# Altium project Martin_Changes.PrjPcb
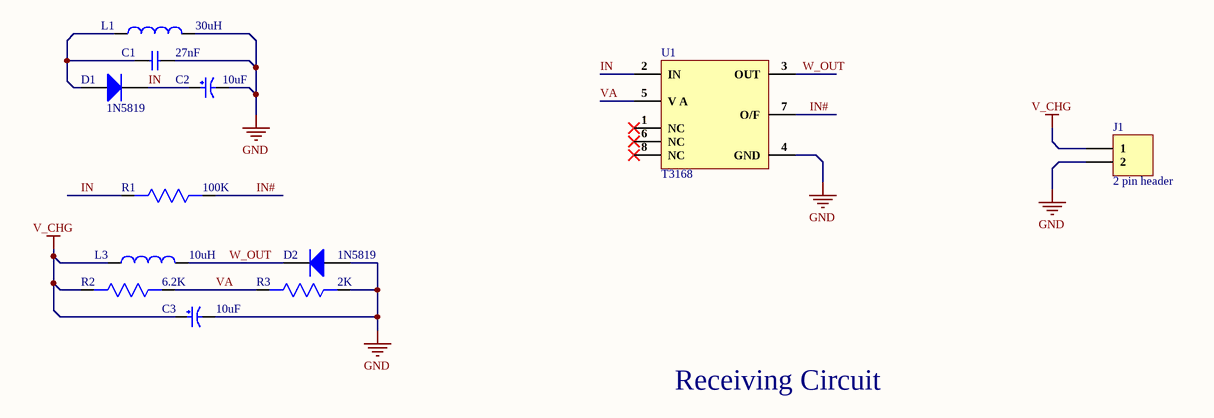
[diagram p0: Wireless_Receiver_Sheet.SchDoc]
2 sheets, 23 parts. Net scope: global (net labels, ports and power ports of the same name join across sheets).
Sheets:
  Wireless_Receiver_Sheet.SchDoc
  Wireless_Transmitter_Sheet.SchDoc

## Sheet Wireless_Receiver_Sheet.SchDoc
size A4

### Parts
C1  27nF  [CAP 0201]
C2  10uF  [Cap Case-C]
C3  10uF  [Cap Case-C]
D1  1N5819
D2  1N5819
J1  2 pin header
L1  30uH  [SRU8028-220Y]
L3  10uH  [SRU8028-220Y]
R1  100K  [Res-0201]
R2  6.2K  [Res-0201]
R3  2K  [Res-0201]
U1  T3168

### Nets
GND: C1.2 C2.1 C3.1 D2.2(A) J1.2 L1.2 R3.1 U1.4(GND)
V_CHG: C3.2 J1.1 L3.1 R2.2
IN: C2.2 D1.1(K) R1.2 U1.2(IN)
IN#: R1.1 U1.7(O/F)
VA: R2.1 R3.2 U1.5(V_A)
W_OUT: D2.1(K) L3.2 U1.3(OUT)
NetC1_1: C1.1 D1.2(A) L1.1

Not connected (* = marked no-connect by the designer): U1 1(NC)* 6(NC)* 8(NC)*

### Notes on the sheet
- Receiving Circuit

### Library data of the parts
C1 = CC0201KRX7R8BB103: CAP CER X7R 0201; Manufacturer: Yageo; Supplier 1: Digi-Key; Manufacturer Part Number: CC0201KRX7R8BB103; RoHS: Yes; Stock 1: 19600; Pricing 1: 1=0.10000, 10=0.02800, 50=0.01520, 100=0.01240, 500=0.00886, 1000=0.00696, 2500=0.00632, 5000=0.00582 (USD); RoHS Compliant: Yes; Supplier Part Number 1: 13-CC0201KRX7R8BB103CT-ND
C2 C3 = 293D106X0025C2TE3: CAP TANT 10UF 20% 25V 2312; Manufacturer: Vishay Sprague; Dielectric Material: Tantalum; ESR (Equivalent Series Resistance): 1.5R; Ripple Current: 190mA; Leakage Current: 2.5uA; Polarity: Polar; Dissipation Factor: 6%; Supplier 1: Digi-Key; Manufacturer Part Number: 293D106X0025C2TE3; RoHS: Yes; Category: Tantalum Capacitors; Stock 1: 14194; Pricing 1: 1=0.45000, 10=0.31600, 50=0.23920, 100=0.20840 (USD); Mount: Surface Mount,PCB; Case/Package: Molded; Number of Pins: 2; Case Code (Metric): 6032; Case Code (Imperial): 2312; Min Operating Temperature: -55°C; Max Operating Temperature: 125°C; Capacitance: 10uF; Tolerance: 20%; Package Quantity: 1; Voltage Rating: 25V; Packaging: Tape and Reel; Voltage Rating (DC): 25V; Termination: SMD/SMT; Features: General Purpose; Series: TANTAMOUNT® 293D; Construction: Flat; Length: 6mm; Width: 0.126inch; Height: 2.5mm; Depth: 3.2mm; Height - Seated (Max): 0.11inch; Radiation Hardening: No; REACH SVHC: Unknown; Lead Free: Lead Free; RoHS Compliant: Yes; ComponentLink1URL: https://datasheet.ciiva.com/258/293d-258835.pdf?src-supplier=Digi-Key; ComponentLink1Description: https://datasheet.ciiva.com/258/293d-258835.pdf?src-supplier=Digi-Key; ComponentLink2URL: https://datasheet.ciiva.com/15163/getdatasheetpartid-87477-15163227.pdf?src-supplier=Verical; ComponentLink2Description: https://datasheet.ciiva.com/15163/getdatasheetpartid-87477-15163227.pdf?src-supplier=Verical; ComponentLink3URL: https://datasheet.ciiva.com/16508/293d-16508059.pdf?src-supplier=Future+Electronics; ComponentLink3Description: https://datasheet.ciiva.com/16508/293d-16508059.pdf?src-supplier=Future+Electronics; ComponentLink4URL: https://datasheet.ciiva.com/3003/293d-3003820.pdf?src-supplier=Avnet; ComponentLink4Description: https://datasheet.ciiva.com/3003/293d-3003820.pdf?src-supplier=Avnet; ComponentLink5URL: https://datasheet.ciiva.com/18444/70212567-18444876.pdf?src-supplier=Allied+Electronics; ComponentLink5Description: https://datasheet.ciiva.com/18444/70212567-18444876.pdf?src-supplier=Allied+Electronics; ComponentLink6URL: https://datasheet.ciiva.com/46382/1796648-46382044.pdf?src-supplier=Element14; ComponentLink6Description: https://datasheet.ciiva.com/46382/1796648-46382044.pdf?src-supplier=Element14; ComponentLink7URL: https://datasheet.ciiva.com/11244/293d-11244094.pdf?src-supplier=Avnet; ComponentLink7Description: https://datasheet.ciiva.com/11244/293d-11244094.pdf?src-supplier=Avnet; ComponentLink8URL: https://datasheet.ciiva.com/16631/293d-16631759.pdf?src-supplier=Avnet+Europe; ComponentLink8Description: https://datasheet.ciiva.com/16631/293d-16631759.pdf?src-supplier=Avnet+Europe; ComponentLink9URL: https://datasheet.ciiva.com/258/293d-258834.pdf?src-supplier=Digi-Key; ComponentLink9Description: https://datasheet.ciiva.com/258/293d-258834.pdf?src-supplier=Digi-Key; ComponentLink10URL: https://datasheet.ciiva.com/258/293d-258836.pdf?src-supplier=Digi-Key; ComponentLink10Description: https://datasheet.ciiva.com/258/293d-258836.pdf?src-supplier=Digi-Key; ComponentLink11URL: https://datasheet.ciiva.com/12884/293d-239871-12884366.pdf?src-supplier=Mouser; ComponentLink11Description: https://datasheet.ciiva.com/12884/293d-239871-12884366.pdf?src-supplier=Mouser; Supplier Part Number 1: 718-1044-1-ND
D1 D2 = diode
L1 L3 = SRU8028-220Y: FIXED IND 22UH 1.6A 106 MOHM SMD; Manufacturer: Bourns; Core Material: Ferrite; Tolerance: 30%; DC Resistance (DCR): 106mR; Self Resonant Frequency: 20MHz; Saturation Current: 1.5A; Shielding: Shielded; Test Frequency: 100kHz; Q Factor: 22; Current: 2.8A; Supplier 1: Digi-Key; Manufacturer Part Number: SRU8028-220Y; RoHS: Yes; Category: Fixed Inductors; Stock 1: 1920; Pricing 1: 1=0.92000, 10=0.85800, 25=0.79200, 50=0.66000, 100=0.62040, 250=0.55440, 500=0.47520 (USD); Mount: Surface Mount; Case/Package: 8028; Number of Pins: 2; Min Operating Temperature: -40°C; Max Operating Temperature: 125°C; Inductance: 22uH; Max DC Current: 1.6A; Packaging: Tape and Reel; Inductance Tolerance: 30%; Package Quantity: 1500; Current Rating: 1.6A; Resistor Type: Wirewound; RMS Current (Irms): 1.6A; Termination: SMD/SMT; DC Current: 1.6A; Series: SRU8028; Length: 0.315inch; Width: 0.315inch; Height: 2.8mm; Height - Seated (Max): 0.122inch; Depth: 8.3mm; Military Standard: Not; REACH SVHC: No SVHC; RoHS Compliant: Yes; ComponentLink1URL: https://datasheet.ciiva.com/3866/41849355s8208904n1506-3866094.pdf?src-supplier=Avnet; ComponentLink1Description: https://datasheet.ciiva.com/3866/41849355s8208904n1506-3866094.pdf?src-supplier=Avnet; ComponentLink2URL: https://datasheet.ciiva.com/3866/41849355s8208904n1506-3866094.pdf?src-supplier=Arrow+Electronics; ComponentLink2Description: https://datasheet.ciiva.com/3866/41849355s8208904n1506-3866094.pdf?src-supplier=Arrow+Electronics; ComponentLink3URL: https://datasheet.ciiva.com/7848/sru8028-7848101.pdf?src-supplier=Element14; ComponentLink3Description: https://datasheet.ciiva.com/7848/sru8028-7848101.pdf?src-supplier=Element14; ComponentLink4URL: https://datasheet.ciiva.com/6691/sru8028-6691830.pdf?src-supplier=Digi-Key; ComponentLink4Description: https://datasheet.ciiva.com/6691/sru8028-6691830.pdf?src-supplier=Digi-Key; ComponentLink5URL: https://datasheet.ciiva.com/7848/1776946-7848102.pdf?src-supplier=Element14; ComponentLink5Description: https://datasheet.ciiva.com/7848/1776946-7848102.pdf?src-supplier=Element14; ComponentLink6URL: https://datasheet.ciiva.com/6691/sru8028-6691834.pdf?src-supplier=Digi-Key; ComponentLink6Description: https://datasheet.ciiva.com/6691/sru8028-6691834.pdf?src-supplier=Digi-Key; ComponentLink7URL: https://datasheet.ciiva.com/6691/sru8028-6691836.pdf?src-supplier=Digi-Key; ComponentLink7Description: https://datasheet.ciiva.com/6691/sru8028-6691836.pdf?src-supplier=Digi-Key; ComponentLink8URL: https://datasheet.ciiva.com/6161/sru8028-6161214.pdf?src-supplier=Farnell; ComponentLink8Description: https://datasheet.ciiva.com/6161/sru8028-6161214.pdf?src-supplier=Farnell; ComponentLink9URL: https://datasheet.ciiva.com/17285/sru8028-17285550.pdf?src-supplier=Avnet+Europe; ComponentLink9Description: https://datasheet.ciiva.com/17285/sru8028-17285550.pdf?src-supplier=Avnet+Europe; Supplier Part Number 1: SRU8028-220YCT-ND
R1 = RC0201FR-07100KL: RES SMD 100K OHM 1% 1/20W 0201; Manufacturer: Yageo; Resistance: 100kR; Power Rating: 50mW; Voltage Rating: 25V; Temperature Coefficient: 200ppm/°C; ComponentLink1URL: http://www.yageo.com/documents/recent/PYu-RC_Group_51_RoHS_L_9.pdf?src-supplier=Digi-Key; ComponentLink1Description: http://www.yageo.com/documents/recent/PYu-RC_Group_51_RoHS_L_9.pdf?src-supplier=Digi-Key; ComponentLink2URL: http://www.yageo.com.tw/exep/pages/download/literatures/PYu-R_INT-thick_7.pdf?src-supplier=Digi-Key; ComponentLink2Description: http://www.yageo.com.tw/exep/pages/download/literatures/PYu-R_INT-thick_7.pdf?src-supplier=Digi-Key; Supplier 1: Digi-Key; Manufacturer Part Number: RC0201FR-07100KL; Stock 1: 2817321; Pricing 1: 1=0.1, 10=0.036, 100=0.0148, 1000=0.0067, 2500=0.0058, 5000=0.0048 (USD); Case/Package: 0201; Number of Pins: 2; Case Code (Imperial): 0201; Case Code (Metric): 0603; Contact Plating: Tin,Matte; Size Code: 0201; Min Operating Temperature: -55°C; Max Operating Temperature: 125°C; Tolerance: 1%; Packaging: Tape and Reel; Package Quantity: 10000; Termination: SMD/SMT; Resistor Type: Thick Film; Number of Terminations: 2; Max Power Dissipation: 50mW; Voltage Rating (DC): 25V; Features: Moisture Resistant; Series: RC; Resistance Tolerance: 1%; Construction: Rectangular; Length: 0.024inch; Width: 0.012inch; Height: 0.01inch; Depth: 0.3mm; REACH SVHC: No SVHC; Military Standard: Not; Lead Free: Lead Free; RoHS Compliant: Yes; ComponentLink3URL: http://www.farnell.com/datasheets/2167052.pdf?src-supplier=Element14; ComponentLink3Description: http://www.farnell.com/datasheets/2167052.pdf?src-supplier=Element14; ComponentLink4URL: http://www.yageo.com/documents/recent/PYu-RC_Group_51_RoHS_L_10.pdf?src-supplier=Digi-Key; ComponentLink4Description: http://www.yageo.com/documents/recent/PYu-RC_Group_51_RoHS_L_10.pdf?src-supplier=Digi-Key; ComponentLink5URL: https://www.verical.com/server-webapp/html/getDatasheet?partID=420441&src-supplier=Verical; ComponentLink5Description: https://www.verical.com/server-webapp/html/getDatasheet?partID=420441&src-supplier=Verical; ComponentLink6URL: http://www.farnell.com/datasheets/1421516.pdf?src-supplier=Element14; ComponentLink6Description: http://www.farnell.com/datasheets/1421516.pdf?src-supplier=Element14; ComponentLink7URL: http://www.yageo.com/documents/recent/PYu-RC0201_51_RoHS_L_8.pdf?src-supplier=Avnet+Europe; ComponentLink7Description: http://www.yageo.com/documents/recent/PYu-RC0201_51_RoHS_L_8.pdf?src-supplier=Avnet+Europe; Supplier Part Number 1: 311-100KMCT-ND
R2 = RMCF0201JT6K20: RES 6.2K OHM 5% 1/20W 0201; Manufacturer: Stackpole Electronics; Resistance: 6.2kR; Max Power Dissipation: 50mW; Temperature Coefficient: 200ppm/°C; Supplier 1: Digi-Key; Manufacturer Part Number: RMCF0201JT6K20; RoHS: Yes; Category: Chip SMD Resistors; Stock 1: 8800; Pricing 1: 1=0.10000, 10=0.01700, 100=0.00710, 1000=0.00318, 2500=0.00276, 5000=0.00228 (USD); Mount: Surface Mount; Case/Package: 0201; Case Code (Metric): 0603; Case Code (Imperial): 0201; Contact Plating: Tin,Matte; Min Operating Temperature: -55°C; Max Operating Temperature: 125°C; Packaging: Tape and Reel; Tolerance: 5%; Resistor Type: Thick Film; Number of Terminations: 2; Series: RMCF; Length: 0.024inch; Width: 0.012inch; Height: 0.009inch; Radiation Hardening: No; RoHS Compliant: Yes; ComponentLink1URL: https://www.seielect.com/catalog/SEI-RMCF_RMCP.pdf?src-supplier=Avnet; ComponentLink1Description: https://www.seielect.com/catalog/SEI-RMCF_RMCP.pdf?src-supplier=Avnet; ComponentLink2URL: https://www.seielect.com/Catalog/SEI-RMCF_RMCP.pdf?src-supplier=Digi-Key; ComponentLink2Description: https://www.seielect.com/Catalog/SEI-RMCF_RMCP.pdf?src-supplier=Digi-Key; ComponentLink3URL: https://www.seielect.com/catalog/SEI-Packaging.pdf?src-supplier=Digi-Key; ComponentLink3Description: https://www.seielect.com/catalog/SEI-Packaging.pdf?src-supplier=Digi-Key; Supplier Part Number 1: RMCF0201JT6K20CT-ND
R3 = RMCF0201JT2K00: RES 2K OHM 5% 1/20W 0201; Manufacturer: Stackpole Electronics; Resistance: 2kR; Power Rating: 50mW; Temperature Coefficient: 200ppm/°C; Supplier 1: Digi-Key; Manufacturer Part Number: RMCF0201JT2K00; RoHS: Yes; Category: Chip SMD Resistors; Stock 1: 15230; Pricing 1: 1=0.10000, 10=0.01700, 100=0.00710, 1000=0.00318, 2500=0.00276, 5000=0.00228 (USD); Mount: Surface Mount; Case/Package: 0201; Case Code (Metric): 0603; Case Code (Imperial): 0201; Contact Plating: Tin,Matte; Min Operating Temperature: -55°C; Max Operating Temperature: 125°C; Packaging: Tape and Reel; Tolerance: 5%; Resistor Type: Thick Film; Number of Terminations: 2; Max Power Dissipation: 50mW; Series: RMCF; Length: 0.024inch; Width: 0.012inch; Height: 0.009inch; Radiation Hardening: No; RoHS Compliant: Yes; ComponentLink1URL: https://www.seielect.com/catalog/SEI-RMCF_RMCP.pdf?src-supplier=Avnet; ComponentLink1Description: https://www.seielect.com/catalog/SEI-RMCF_RMCP.pdf?src-supplier=Avnet; ComponentLink2URL: https://www.seielect.com/Catalog/SEI-RMCF_RMCP.pdf?src-supplier=Digi-Key; ComponentLink2Description: https://www.seielect.com/Catalog/SEI-RMCF_RMCP.pdf?src-supplier=Digi-Key; ComponentLink3URL: https://www.seielect.com/catalog/SEI-RMCF_RMCP.pdf?src-supplier=Avnet+Asia; ComponentLink3Description: https://www.seielect.com/catalog/SEI-RMCF_RMCP.pdf?src-supplier=Avnet+Asia; Supplier Part Number 1: RMCF0201JT2K00CT-ND

## Sheet Wireless_Transmitter_Sheet.SchDoc
size A4
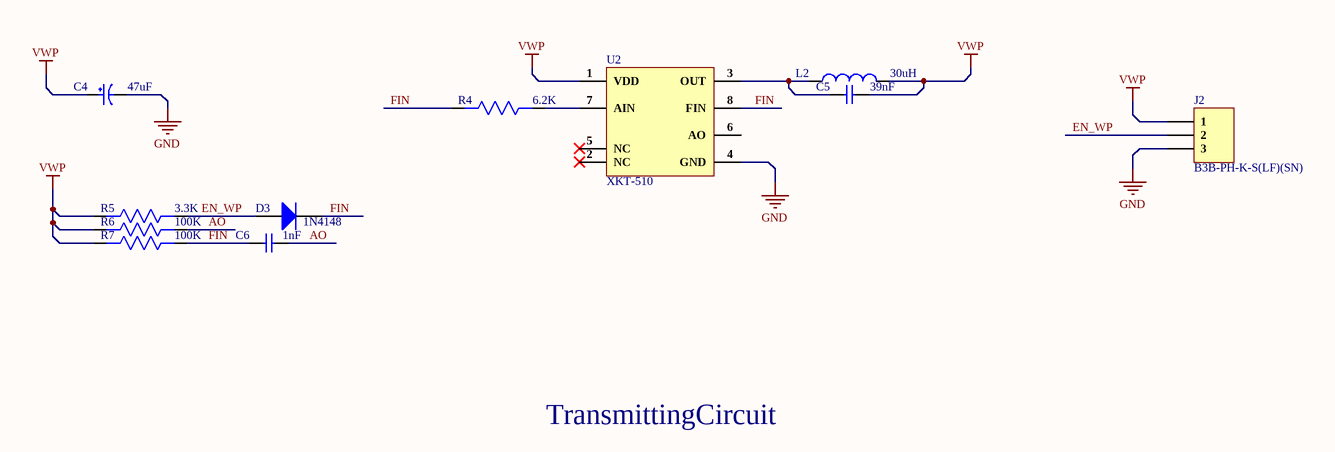
[diagram p1: Wireless_Transmitter_Sheet.SchDoc]

### Parts
C4  47uF  [Cap Case-C]
C5  39nF  [CAP 0201]
C6  1nF  [CAP 0201]
D3  1N4148
J2  B3B-PH-K-S(LF)(SN)  [B3B-PH-K-S(LF)(SN)]
L2  30uH  [SRU8028-220Y]
R4  6.2K  [Res-0201]
R5  3.3K  [Res-0201]
R6  100K  [Res-0201]
R7  100K  [Res-0201]
U2  XKT-510

### Nets
GND: C4.1 J2.3 U2.4(GND)
VWP: C4.2 C5.2 J2.1 L2.2 R5.2 R6.2 R7.2 U2.1(VDD)
AO: C6.2 R6.1
EN_WP: D3.2(A) J2.2 R5.1
FIN: C6.1 D3.1(K) R4.2 R7.1 U2.8(FIN)
NetC5_1: C5.1 L2.1 U2.3(OUT)
NetR4_1: R4.1 U2.7(AIN)

Not connected (* = marked no-connect by the designer): U2 2(NC)* 5(NC)* 6(AO)

### Notes on the sheet
- TransmittingCircuit

### Library data of the parts
C4 = 293D106X0025C2TE3: as C2 on sheet Wireless_Receiver_Sheet; Supplier 1: Digi-Key; Manufacturer Part Number: 293D106X0025C2TE3; RoHS: Yes; Category: Tantalum Capacitors; Stock 1: 14194; Pricing 1: 1=0.45000, 10=0.31600, 50=0.23920, 100=0.20840 (USD); Mount: Surface Mount,PCB; Case/Package: Molded; Number of Pins: 2; Case Code (Metric): 6032; Case Code (Imperial): 2312; Min Operating Temperature: -55°C; Max Operating Temperature: 125°C; Capacitance: 10uF; Tolerance: 20%; Package Quantity: 1; Voltage Rating: 25V; Packaging: Tape and Reel; Voltage Rating (DC): 25V; Termination: SMD/SMT; Features: General Purpose; Series: TANTAMOUNT® 293D; Construction: Flat; Length: 6mm; Width: 0.126inch; Height: 2.5mm; Depth: 3.2mm; Height - Seated (Max): 0.11inch; Radiation Hardening: No; REACH SVHC: Unknown; Lead Free: Lead Free; RoHS Compliant: Yes; ComponentLink1URL: https://datasheet.ciiva.com/258/293d-258835.pdf?src-supplier=Digi-Key; ComponentLink1Description: https://datasheet.ciiva.com/258/293d-258835.pdf?src-supplier=Digi-Key; ComponentLink2URL: https://datasheet.ciiva.com/15163/getdatasheetpartid-87477-15163227.pdf?src-supplier=Verical; ComponentLink2Description: https://datasheet.ciiva.com/15163/getdatasheetpartid-87477-15163227.pdf?src-supplier=Verical; ComponentLink3URL: https://datasheet.ciiva.com/16508/293d-16508059.pdf?src-supplier=Future+Electronics; ComponentLink3Description: https://datasheet.ciiva.com/16508/293d-16508059.pdf?src-supplier=Future+Electronics; ComponentLink4URL: https://datasheet.ciiva.com/3003/293d-3003820.pdf?src-supplier=Avnet; ComponentLink4Description: https://datasheet.ciiva.com/3003/293d-3003820.pdf?src-supplier=Avnet; ComponentLink5URL: https://datasheet.ciiva.com/18444/70212567-18444876.pdf?src-supplier=Allied+Electronics; ComponentLink5Description: https://datasheet.ciiva.com/18444/70212567-18444876.pdf?src-supplier=Allied+Electronics; ComponentLink6URL: https://datasheet.ciiva.com/46382/1796648-46382044.pdf?src-supplier=Element14; ComponentLink6Description: https://datasheet.ciiva.com/46382/1796648-46382044.pdf?src-supplier=Element14; ComponentLink7URL: https://datasheet.ciiva.com/11244/293d-11244094.pdf?src-supplier=Avnet; ComponentLink7Description: https://datasheet.ciiva.com/11244/293d-11244094.pdf?src-supplier=Avnet; ComponentLink8URL: https://datasheet.ciiva.com/16631/293d-16631759.pdf?src-supplier=Avnet+Europe; ComponentLink8Description: https://datasheet.ciiva.com/16631/293d-16631759.pdf?src-supplier=Avnet+Europe; ComponentLink9URL: https://datasheet.ciiva.com/258/293d-258834.pdf?src-supplier=Digi-Key; ComponentLink9Description: https://datasheet.ciiva.com/258/293d-258834.pdf?src-supplier=Digi-Key; ComponentLink10URL: https://datasheet.ciiva.com/258/293d-258836.pdf?src-supplier=Digi-Key; ComponentLink10Description: https://datasheet.ciiva.com/258/293d-258836.pdf?src-supplier=Digi-Key; ComponentLink11URL: https://datasheet.ciiva.com/12884/293d-239871-12884366.pdf?src-supplier=Mouser; ComponentLink11Description: https://datasheet.ciiva.com/12884/293d-239871-12884366.pdf?src-supplier=Mouser; Supplier Part Number 1: 718-1044-1-ND
C5 C6 = CC0201KRX7R8BB103: CAP CER X7R 0201; Manufacturer: Yageo; Supplier 1: Digi-Key; Manufacturer Part Number: CC0201KRX7R8BB103; RoHS: Yes; Stock 1: 19600; Pricing 1: 1=0.10000, 10=0.02800, 50=0.01520, 100=0.01240, 500=0.00886, 1000=0.00696, 2500=0.00632, 5000=0.00582 (USD); RoHS Compliant: Yes; Supplier Part Number 1: 13-CC0201KRX7R8BB103CT-ND
D3 = diode
J2 = B3B-PH-K-S(LF)(SN): CONN HEADER VERT 3POS 2MM; Manufacturer: JST; Number of Positions: 3; Connector Type: Male Pin; Current Rating: 2A; Contact Resistance: 20mR; Voltage Rating (AC): 100V; Insulation Resistance: 1MR; Gender: Male; Supplier 1: Future Electronics; Manufacturer Part Number: B3B-PH-K-S(LF)(SN); RoHS: Yes; Category: Headers and Wire Housings; Pricing 1: 1=0.07800, 500=0.06750, 1500=0.06580, 5000=0.06400, 15000=0.06240 (USD); Mount: Through Hole; Number of Pins: 3; Contact Plating: Tin,Copper; Color: Natural; Contact Material: Brass,Tin; Housing Color: White; Housing Material: Polyamide; Min Operating Temperature: -25°C; Max Operating Temperature: 85°C; Number of Rows: 1; Packaging: Bulk; Max Current Rating: 2A; Number of Poles: 3; Voltage Rating: 100V; Termination: Solder; Fastening Type: Detent; Number of Contacts: 3; Max Voltage Rating (AC): 100V; Max Voltage Rating (DC): 100V; Working Voltage: 100V; Orientation: Straight; Length: 7.9mm; Width: 4.5mm; Height: 9.4mm; Pitch: 2mm; Lead Pitch: 2mm; Contact Mating Length: 0.13inch; Depth: 4.5mm; Lead Free: Lead Free; REACH SVHC: No SVHC; ComponentLink1URL: https://datasheet.ciiva.com/6747/80560-6747401.pdf?src-supplier=Newark; ComponentLink1Description: https://datasheet.ciiva.com/6747/80560-6747401.pdf?src-supplier=Newark; ComponentLink2URL: https://datasheet.ciiva.com/11746/0900766b80826550-11746939.pdf?src-supplier=RSComponents; ComponentLink2Description: https://datasheet.ciiva.com/11746/0900766b80826550-11746939.pdf?src-supplier=RSComponents; ComponentLink3URL: https://datasheet.ciiva.com/26894/getdatasheetpartid-448114-26894774.pdf?src-supplier=Verical; ComponentLink3Description: https://datasheet.ciiva.com/26894/getdatasheetpartid-448114-26894774.pdf?src-supplier=Verical; ComponentLink4URL: https://datasheet.ciiva.com/712/eph-712455.pdf?src-supplier=Digi-Key; ComponentLink4Description: https://datasheet.ciiva.com/712/eph-712455.pdf?src-supplier=Digi-Key; ComponentLink5URL: https://datasheet.ciiva.com/26924/getdatasheetpartid-651387-26924028.pdf?src-supplier=Verical; ComponentLink5Description: https://datasheet.ciiva.com/26924/getdatasheetpartid-651387-26924028.pdf?src-supplier=Verical; ComponentLink6URL: https://datasheet.ciiva.com/16200/eph-16200926.pdf?src-supplier=Future+Electronics; ComponentLink6Description: https://datasheet.ciiva.com/16200/eph-16200926.pdf?src-supplier=Future+Electronics; ComponentLink7URL: https://datasheet.ciiva.com/43491/741202-da-01-en-stiftleiste-gerade-3-pol-rm2-0-43491962.pdf?src-supplier=Conrad; ComponentLink7Description: https://datasheet.ciiva.com/43491/741202-da-01-en-stiftleiste-gerade-3-pol-rm2-0-43491962.pdf?src-supplier=Conrad; Supplier Part Number 1: 6478077
L2 = SRU8028-220Y: as L1 on sheet Wireless_Receiver_Sheet; Supplier 1: Digi-Key; Manufacturer Part Number: SRU8028-220Y; RoHS: Yes; Category: Fixed Inductors; Stock 1: 1920; Pricing 1: 1=0.92000, 10=0.85800, 25=0.79200, 50=0.66000, 100=0.62040, 250=0.55440, 500=0.47520 (USD); Mount: Surface Mount; Case/Package: 8028; Number of Pins: 2; Min Operating Temperature: -40°C; Max Operating Temperature: 125°C; Inductance: 22uH; Max DC Current: 1.6A; Packaging: Tape and Reel; Inductance Tolerance: 30%; Package Quantity: 1500; Current Rating: 1.6A; Resistor Type: Wirewound; RMS Current (Irms): 1.6A; Termination: SMD/SMT; DC Current: 1.6A; Series: SRU8028; Length: 0.315inch; Width: 0.315inch; Height: 2.8mm; Height - Seated (Max): 0.122inch; Depth: 8.3mm; Military Standard: Not; REACH SVHC: No SVHC; RoHS Compliant: Yes; ComponentLink1URL: https://datasheet.ciiva.com/3866/41849355s8208904n1506-3866094.pdf?src-supplier=Avnet; ComponentLink1Description: https://datasheet.ciiva.com/3866/41849355s8208904n1506-3866094.pdf?src-supplier=Avnet; ComponentLink2URL: https://datasheet.ciiva.com/3866/41849355s8208904n1506-3866094.pdf?src-supplier=Arrow+Electronics; ComponentLink2Description: https://datasheet.ciiva.com/3866/41849355s8208904n1506-3866094.pdf?src-supplier=Arrow+Electronics; ComponentLink3URL: https://datasheet.ciiva.com/7848/sru8028-7848101.pdf?src-supplier=Element14; ComponentLink3Description: https://datasheet.ciiva.com/7848/sru8028-7848101.pdf?src-supplier=Element14; ComponentLink4URL: https://datasheet.ciiva.com/6691/sru8028-6691830.pdf?src-supplier=Digi-Key; ComponentLink4Description: https://datasheet.ciiva.com/6691/sru8028-6691830.pdf?src-supplier=Digi-Key; ComponentLink5URL: https://datasheet.ciiva.com/7848/1776946-7848102.pdf?src-supplier=Element14; ComponentLink5Description: https://datasheet.ciiva.com/7848/1776946-7848102.pdf?src-supplier=Element14; ComponentLink6URL: https://datasheet.ciiva.com/6691/sru8028-6691834.pdf?src-supplier=Digi-Key; ComponentLink6Description: https://datasheet.ciiva.com/6691/sru8028-6691834.pdf?src-supplier=Digi-Key; ComponentLink7URL: https://datasheet.ciiva.com/6691/sru8028-6691836.pdf?src-supplier=Digi-Key; ComponentLink7Description: https://datasheet.ciiva.com/6691/sru8028-6691836.pdf?src-supplier=Digi-Key; ComponentLink8URL: https://datasheet.ciiva.com/6161/sru8028-6161214.pdf?src-supplier=Farnell; ComponentLink8Description: https://datasheet.ciiva.com/6161/sru8028-6161214.pdf?src-supplier=Farnell; ComponentLink9URL: https://datasheet.ciiva.com/17285/sru8028-17285550.pdf?src-supplier=Avnet+Europe; ComponentLink9Description: https://datasheet.ciiva.com/17285/sru8028-17285550.pdf?src-supplier=Avnet+Europe; Supplier Part Number 1: SRU8028-220YCT-ND
R4-R7 = RMCF0201JT2K00: as R3 on sheet Wireless_Receiver_Sheet; Supplier 1: Digi-Key; Manufacturer Part Number: RMCF0201JT2K00; RoHS: Yes; Category: Chip SMD Resistors; Stock 1: 15230; Pricing 1: 1=0.10000, 10=0.01700, 100=0.00710, 1000=0.00318, 2500=0.00276, 5000=0.00228 (USD); Mount: Surface Mount; Case/Package: 0201; Case Code (Metric): 0603; Case Code (Imperial): 0201; Contact Plating: Tin,Matte; Min Operating Temperature: -55°C; Max Operating Temperature: 125°C; Packaging: Tape and Reel; Tolerance: 5%; Resistor Type: Thick Film; Number of Terminations: 2; Max Power Dissipation: 50mW; Series: RMCF; Length: 0.024inch; Width: 0.012inch; Height: 0.009inch; Radiation Hardening: No; RoHS Compliant: Yes; ComponentLink1URL: https://www.seielect.com/catalog/SEI-RMCF_RMCP.pdf?src-supplier=Avnet; ComponentLink1Description: https://www.seielect.com/catalog/SEI-RMCF_RMCP.pdf?src-supplier=Avnet; ComponentLink2URL: https://www.seielect.com/Catalog/SEI-RMCF_RMCP.pdf?src-supplier=Digi-Key; ComponentLink2Description: https://www.seielect.com/Catalog/SEI-RMCF_RMCP.pdf?src-supplier=Digi-Key; ComponentLink3URL: https://www.seielect.com/catalog/SEI-RMCF_RMCP.pdf?src-supplier=Avnet+Asia; ComponentLink3Description: https://www.seielect.com/catalog/SEI-RMCF_RMCP.pdf?src-supplier=Avnet+Asia; Supplier Part Number 1: RMCF0201JT2K00CT-ND

## Nets that join several sheets
GND: Wireless_Receiver_Sheet (8 pins), Wireless_Transmitter_Sheet (C4.1 J2.3 U2.4)